# Altium project Stepper_STM32_V8.PrjPcb
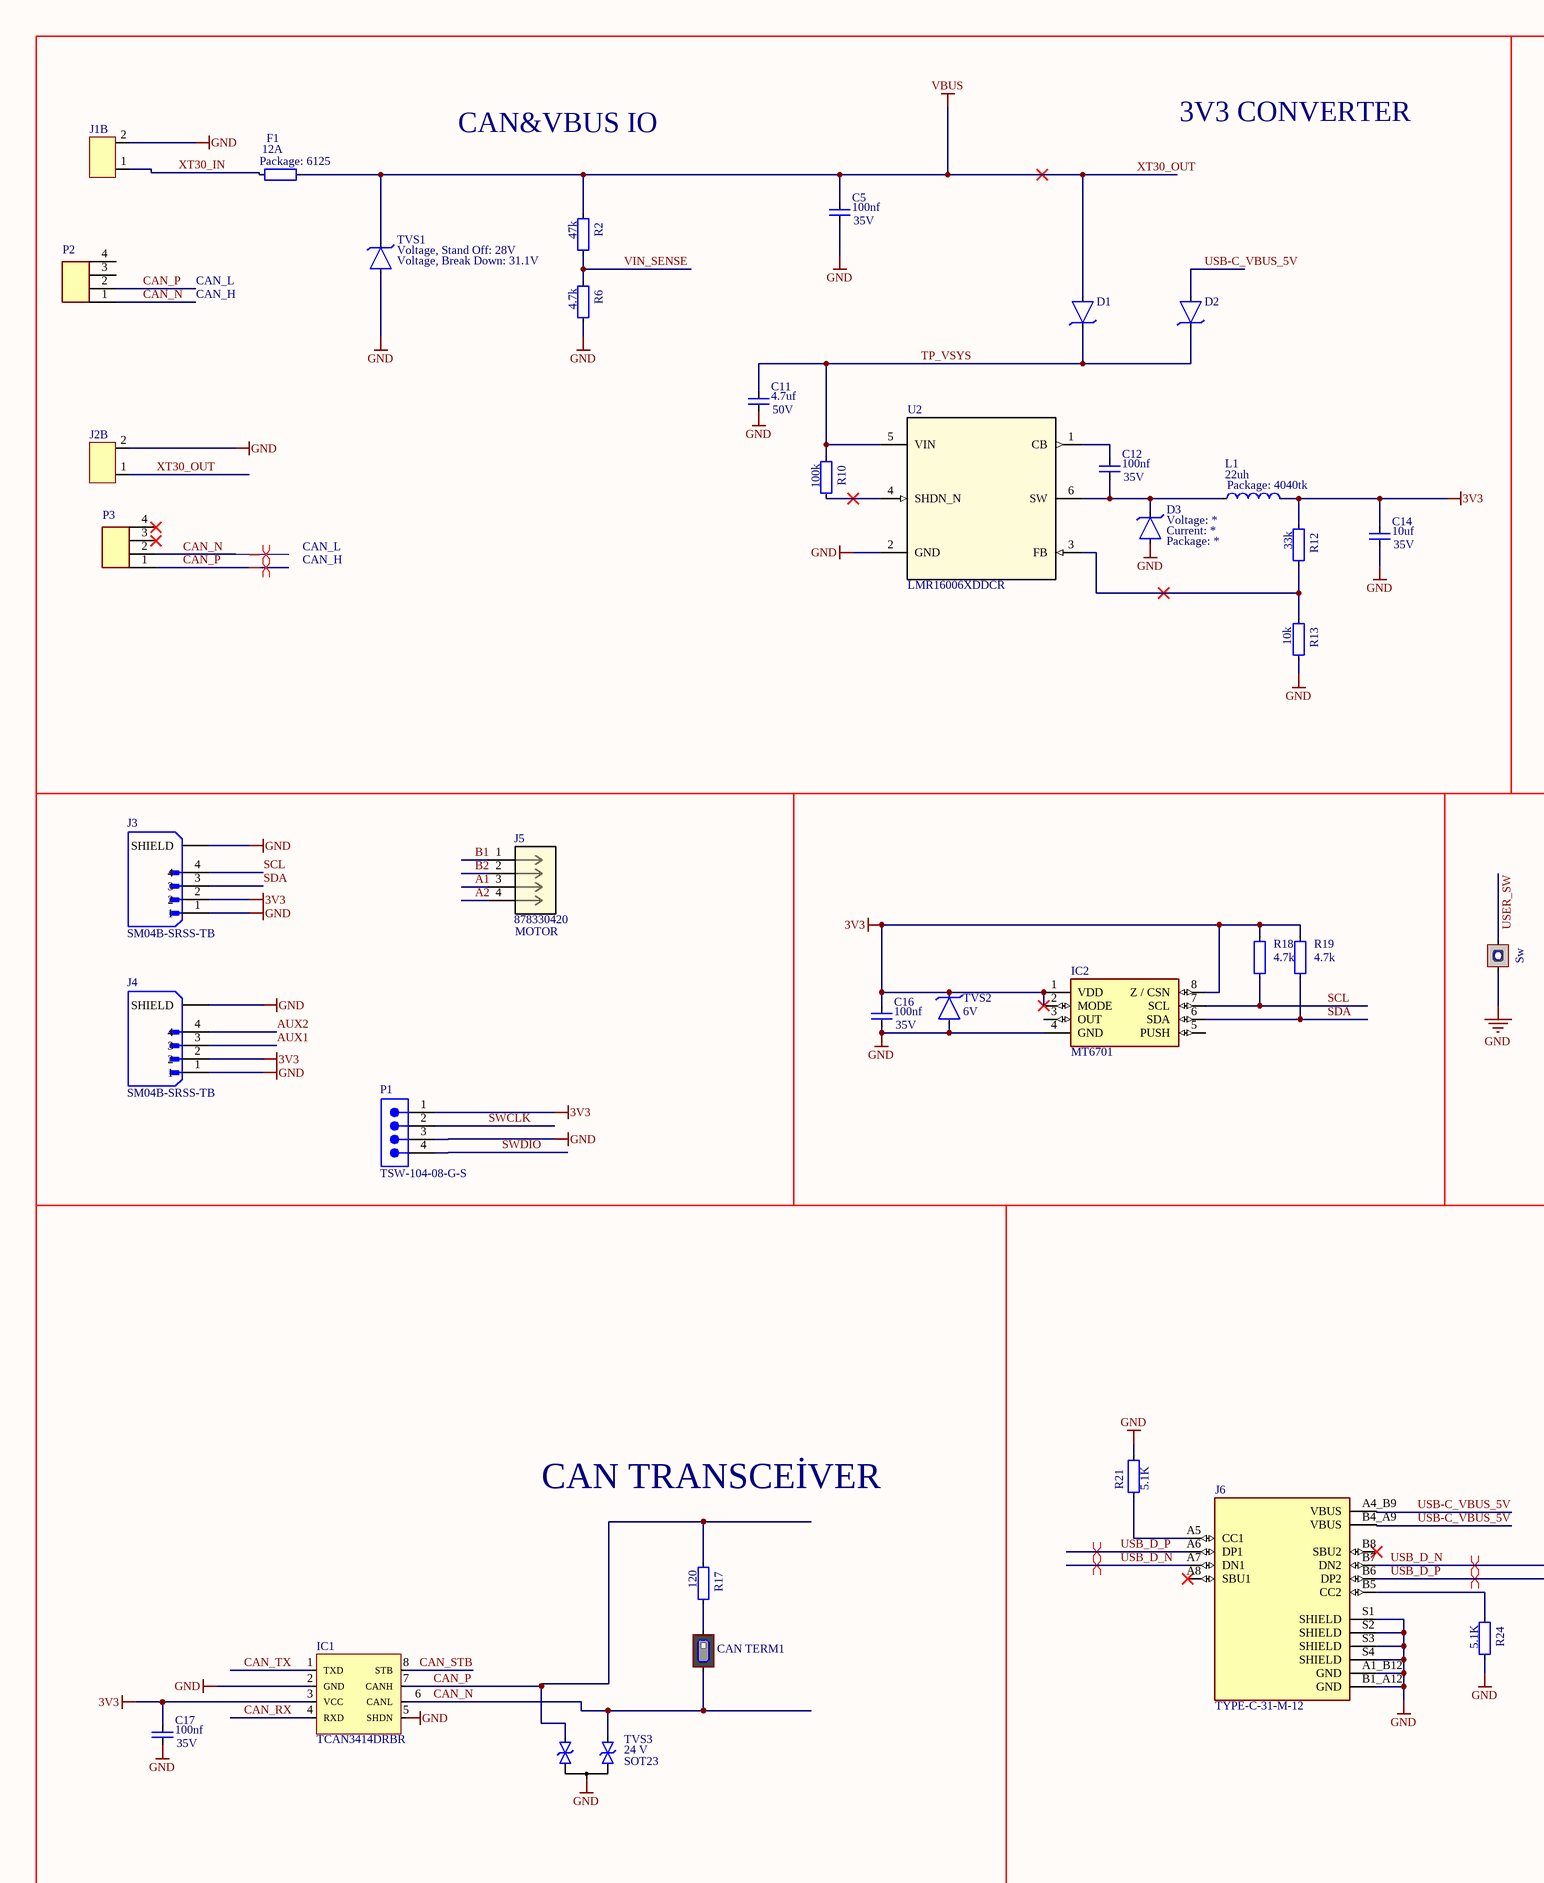
[diagram p0: CanBUS_stepper_STM32.SchDoc, left]
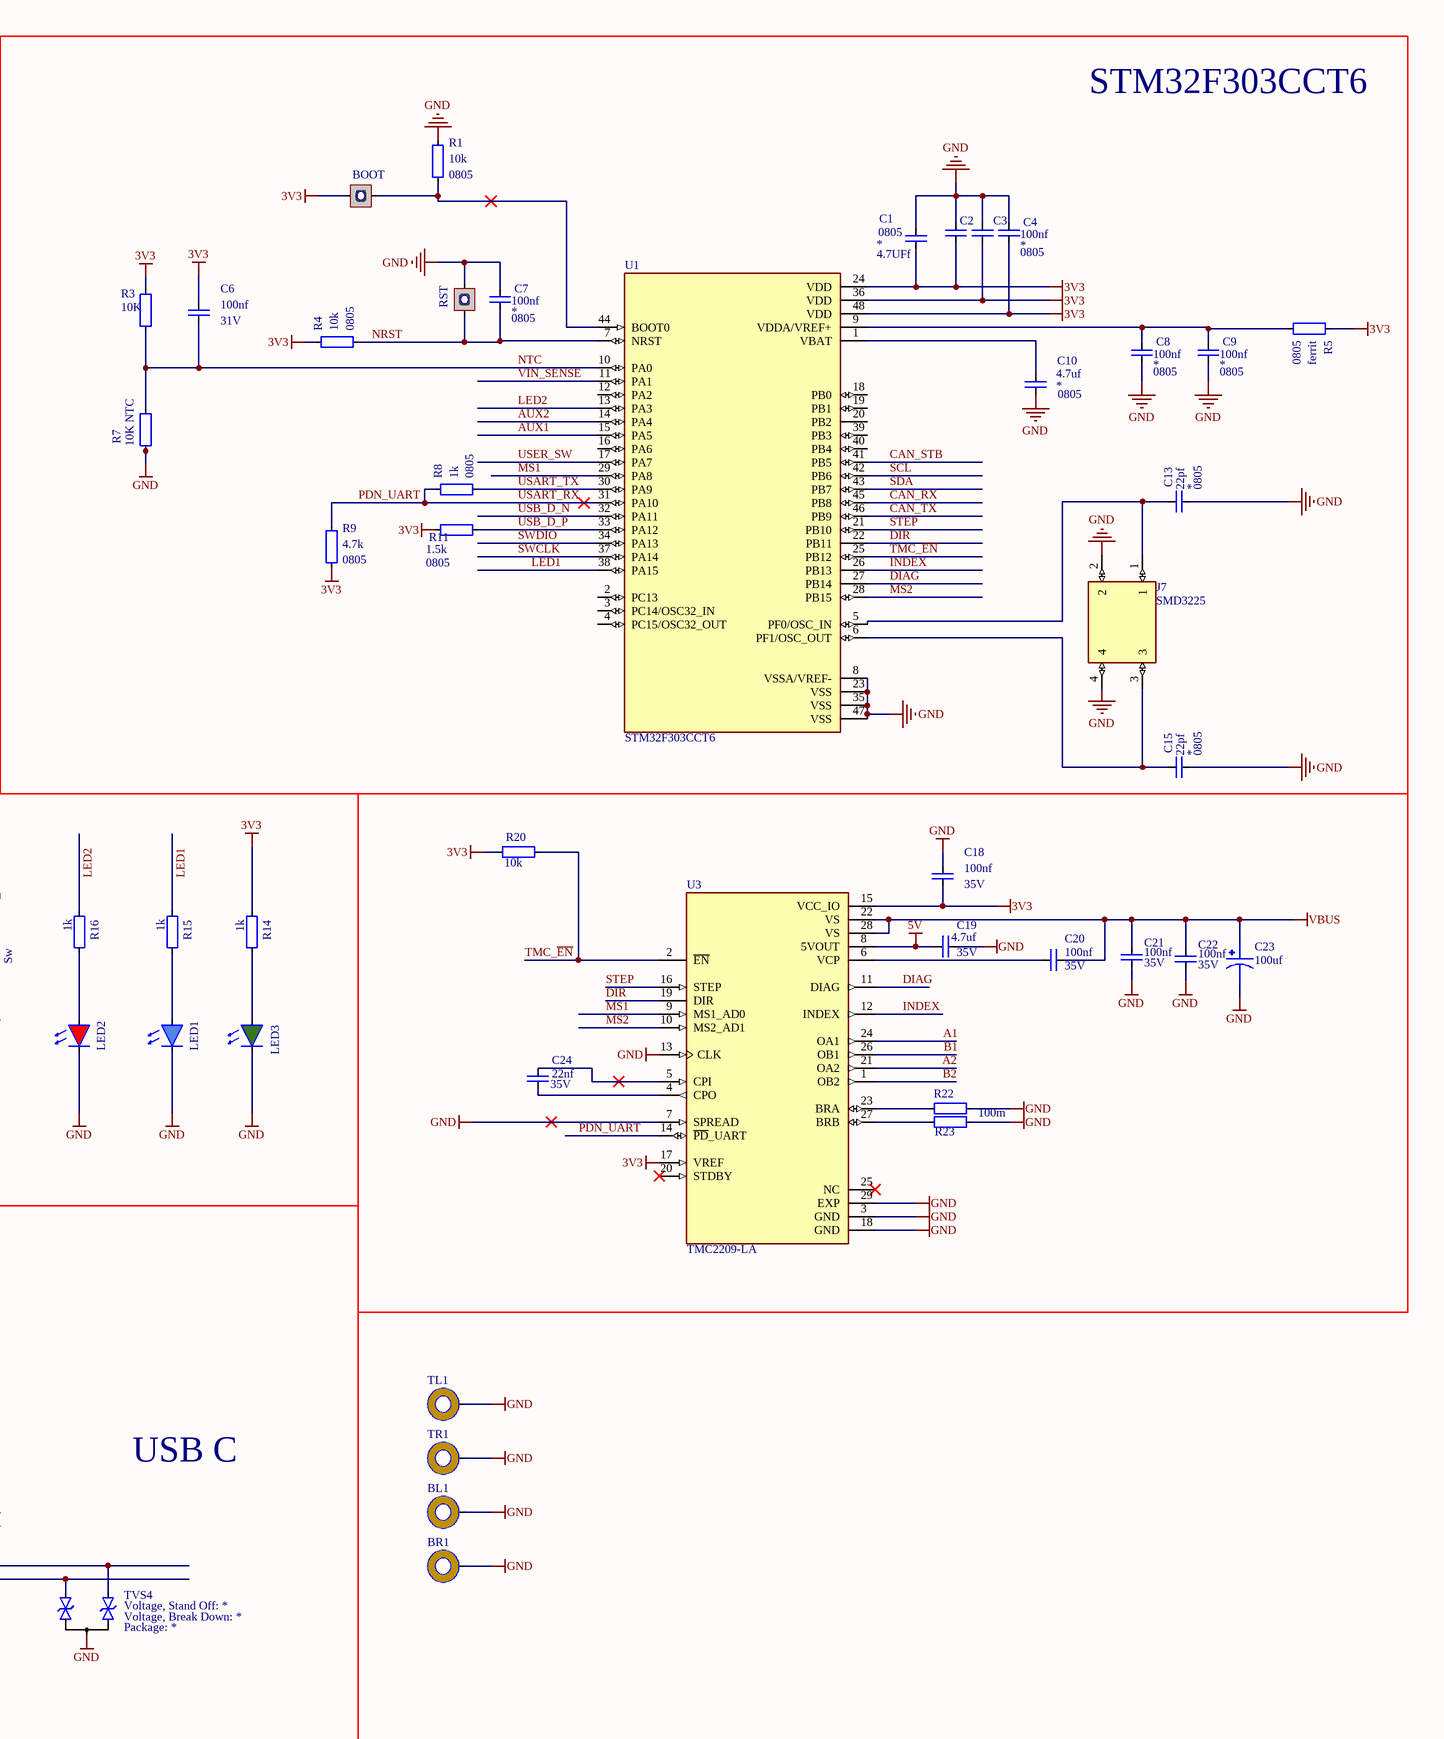
[diagram p1: CanBUS_stepper_STM32.SchDoc, right]
1 sheet, 83 parts. Net scope: global (net labels, ports and power ports of the same name join across sheets).
Board file: CanBUS_stepper_STM32.PcbDoc

## Sheet CanBUS_stepper_STM32.SchDoc
size A2; SheetNumber: 1; SheetTotal: 1

### Parts
BL1  Mounting Hole  [Mounting Hole - Hole-3.2mm, Pad-5mm]  (value not drawn)  (no BOM)
BOOT  Tactile, SPST  [SW_PTS810_SJM_250_SMTR_LFS]  (value not drawn)
BR1  Mounting Hole  [Mounting Hole - Hole-3.2mm, Pad-5mm]  (value not drawn)  (no BOM)
C1  value 4.7UFf  Package: 0805  [Capacitor_Ceramic_M2012_I0805]  (hidden comment: Capacitor_Ceramic)
C2  Capacitor_Ceramic  [Capacitor_Ceramic_M2012_I0805]  (value not drawn)
C3  Capacitor_Ceramic  [Capacitor_Ceramic_M2012_I0805]  (value not drawn)
C4  value 100nf  Package: 0805  [Capacitor_Ceramic_M2012_I0805]  (hidden comment: Capacitor_Ceramic)
C5  value 100nf  Voltage: 35V  [Capacitor_Ceramic_M2012_I0805]  (hidden comment: Capacitor_Ceramic)
C6  value 100nf  Voltage: 31V  [Capacitor_Ceramic_M2012_I0805]  (hidden comment: Capacitor_Ceramic)
C7  value 100nf  Package: 0805  [Capacitor_Ceramic_M2012_I0805]  (hidden comment: Capacitor_Ceramic)
C8  value 100nf  Package: 0805  [Capacitor_Ceramic_M2012_I0805]  (hidden comment: Capacitor_Ceramic)
C9  value 100nf  Package: 0805  [Capacitor_Ceramic_M2012_I0805]  (hidden comment: Capacitor_Ceramic)
C10  value 4.7uf  Package: 0805  [Capacitor_Ceramic_M2012_I0805]  (hidden comment: Capacitor_Ceramic)
C11  value 4.7uf  Voltage: 50V  [Capacitor_Ceramic_M2012_I0805]  (hidden comment: Capacitor_Ceramic)
C12  value 100nf  Voltage: 35V  [Capacitor_Ceramic_M2012_I0805]  (hidden comment: Capacitor_Ceramic)
C13  value 22pf  Package: 0805  [Capacitor_Ceramic_M2012_I0805]  (hidden comment: Capacitor_Ceramic)
C14  value 10uf  Voltage: 35V  [Capacitor_Ceramic_M3216_I1206]  (hidden comment: Capacitor_Ceramic)
C15  value 22pf  Package: 0805  [Capacitor_Ceramic_M2012_I0805]  (hidden comment: Capacitor_Ceramic)
C16  value 100nf  Voltage: 35V  [Capacitor_Ceramic_M2012_I0805]  (hidden comment: Capacitor_Ceramic)
C17  value 100nf  Voltage: 35V  [Capacitor_Ceramic_M2012_I0805]  (hidden comment: Capacitor_Ceramic)
C18  value 100nf  Voltage: 35V  [Capacitor_Ceramic_M2012_I0805]  (hidden comment: Capacitor_Ceramic)
C19  value 4.7uf  Voltage: 35V  [Capacitor_Ceramic_M2012_I0805]  (hidden comment: Capacitor_Ceramic)
C20  value 100nf  Voltage: 35V  [Capacitor_Ceramic_M2012_I0805]  (hidden comment: Capacitor_Ceramic)
C21  value 100nf  Voltage: 35V  [Capacitor_Ceramic_M2012_I0805]  (hidden comment: Capacitor_Ceramic)
C22  value 100nf  Voltage: 35V  [Capacitor_Ceramic_M2012_I0805]  (hidden comment: Capacitor_Ceramic)
C23  value 100uf  [CAPACİTOR_6.3_5.4]  (hidden comment: MAL214699103E3)
C24  value 22nf  Voltage: 35V  [Capacitor_Ceramic_M2012_I0805]  (hidden comment: Capacitor_Ceramic)
CAN_TERM1  Slide, SPST  [Slide, SPST - C&K, SDA01HxS]  (value not drawn)
D1  Diode_Tvs  [DO214AA SMB]  (value not drawn)
D2  Diode_Tvs  [DO214AA SMB]  (value not drawn)
D3  Diode_Zener  [Diode_SOD-123F]  (value not drawn)
F1  value 12A  Package: 6125  [Resistor_Smd_M6332_I2512]  (hidden comment: Resistor)
IC1  TCAN3414DRBR  [TCAN3414DRBR]
IC2  MT6701  [SOIC-8, NB]
J1  2pin_header  [2pin_header]  (value not drawn)  (part B of 2)
J2  2pin_header  [2pin_header]  (value not drawn)  (part B of 2)
J3  SM04B-SRSS-TB  [SM04B-SRSS-TB]
J4  SM04B-SRSS-TB  [SM04B-SRSS-TB]
J5  878330420  [0878330420]
J6  TYPE-C-31-M-12  [HRO_TYPE-C-31-M-12]
J7  SMD3225  [SMD3225]
L1  value 22uh  Package: 4040tk  [Taiyo Yuden - Power Inductor, 4040TK]  (hidden comment: Inductor)
LED1  Diode_Led  [Diode_Smd_M1608_I0603_Blue]  (value not drawn)
LED2  Diode_Led  [Diode_Smd_M1608_I0603_Red]  (value not drawn)
LED3  Diode_Led  [Diode_Smd_M1608_I0603_Green]  (value not drawn)
P1  TSW-104-08-G-S  [SMTC-TSW-104-08-X-S]
P2  S2B-ZR-SM4A-TF  [JST_S2B-ZR-SM4A-TF]  (value not drawn)
P3  S2B-ZR-SM4A-TF  [JST_S2B-ZR-SM4A-TF]  (value not drawn)
R1  value 10k  Package: 0805  [Resistor_Smd_M2012_I0805]  (hidden comment: Resistor)
R2  value 47k  [Resistor_Smd_M2012_I0805]  (hidden comment: Resistor)
R3  value 10K  [Resistor_Smd_M2012_I0805]  (hidden comment: Resistor)
R4  value 10k  Package: 0805  [Resistor_Smd_M2012_I0805]  (hidden comment: Resistor)
R5  value ferrit  Package: 0805  [Resistor_Smd_M2012_I0805]  (hidden comment: Resistor)
R6  value 4.7k  [Resistor_Smd_M2012_I0805]  (hidden comment: Resistor)
R7  value 10K NTC  [Resistor_Smd_M2012_I0805]  (hidden comment: Resistor)
R8  value 1k  Package: 0805  [Resistor_Smd_M2012_I0805]  (hidden comment: Resistor)
R9  value 4.7k  Package: 0805  [Resistor_Smd_M2012_I0805]  (hidden comment: Resistor)
R10  value 100k  [Resistor_Smd_M2012_I0805]  (hidden comment: Resistor)
R11  value 1.5k  Package: 0805  [Resistor_Smd_M2012_I0805]  (hidden comment: Resistor)
R12  value 33k  [Resistor_Smd_M2012_I0805]  (hidden comment: Resistor)
R13  value 10k  [Resistor_Smd_M2012_I0805]  (hidden comment: Resistor)
R14  value 1k  [Resistor_Smd_M2012_I0805]  (hidden comment: Resistor)
R15  value 1k  [Resistor_Smd_M2012_I0805]  (hidden comment: Resistor)
R16  value 1k  [Resistor_Smd_M2012_I0805]  (hidden comment: Resistor)
R17  value 120  [Resistor_Smd_M2012_I0805]  (hidden comment: Resistor)
R18  value 4.7k  [Resistor_Smd_M2012_I0805]  (hidden comment: Resistor)
R19  value 4.7k  [Resistor_Smd_M2012_I0805]  (hidden comment: Resistor)
R20  value 10k  [Resistor_Smd_M2012_I0805]  (hidden comment: Resistor)
R21  value 5.1K  [Resistor_Smd_M2012_I0805]  (hidden comment: Resistor)
R22  value 100m  [Resistor_Smd_M3216_I1206]  (hidden comment: Resistor)
R23  Resistor  [Resistor_Smd_M3216_I1206]  (value not drawn)
R24  value 5.1K  [Resistor_Smd_M2012_I0805]  (hidden comment: Resistor)
RST  Tactile, SPST  [SW_PTS810_SJM_250_SMTR_LFS]  (value not drawn)
Sw  Tactile, SPST  [SW_PTS810_SJM_250_SMTR_LFS]  (value not drawn)
TL1  Mounting Hole  [Mounting Hole - Hole-3.2mm, Pad-5mm]  (value not drawn)  (no BOM)
TR1  Mounting Hole  [Mounting Hole - Hole-3.2mm, Pad-5mm]  (value not drawn)  (no BOM)
TVS1  Voltage, Break Down: 31.1V  Voltage, Stand Off: 28V  [DO214AA SMB]  (hidden comment: Diode_Tvs)
TVS2  Voltage, Stand Off: 6V  [DO214AA SMB]  (hidden comment: Diode_Tvs)
TVS3  Voltage, Stand Off: 24 V  Package: SOT23  [Diode_SOT-23-3_2P_Bidirectional_Type_1]  (hidden comment: Diode_Tvs_2P_Bidirectional)
TVS4  Diode_Tvs_2P_Bidirectional  [Diode_SOT-23-3_2P_Bidirectional_Type_1]  (value not drawn)
U1  STM32F303CCT6  [QFP-48, 7mm x 7mm, 0.5mm]
U2  LMR16006XDDCR  [DDC0006A]
U3  TMC2209-LA  [QFN50P500X500X90-29N]

### Blocks framed on the sheet
STM32F303CCT6: BOOT C1-C4 C6-C10 C13 C15 J7 R1 R3-R5 R7-R9 R11 RST U1

### Nets
3V3: BOOT.A C1.1 C2.2 C3.2 C4.2 C6.1 C14.1 C16.1 C17.1 C18.2 IC1.3(VCC) IC2.1(VDD) IC2.2(MODE) IC2.8(Z_/_CSN) J3.2 J4.2 L1.2 P1.1 R3.1 R4.1 R5.1 R9.2 R11.1 R12.2 R14.2 R18.1 R19.1 R20.2 TVS2.C U1.24(VDD) U1.36(VDD) U1.48(VDD) U3.15(VCC_IO) U3.17(VREF)
5V: C19.2 U3.8(5VOUT)
GND: BL1.Hole BR1.Hole C1.2 C2.1 C3.1 C4.1 C5.2 C7.1 C8.2 C9.2 C10.2 C11.2 C13.2 C14.2 C15.2 C16.2 C17.2 C18.1 C19.1 C21.2 C22.2 C23.2(-) D3.A IC1.2(GND) IC1.5(SHDN) IC2.4(GND) J1.2 J2.2 J3.1 J3.SHIELD J4.1 J4.SHIELD J6.A1_B12(GND) J6.B1_A12(GND) J6.S1(SHIELD) J6.S2(SHIELD) J6.S3(SHIELD) J6.S4(SHIELD) J7.2 J7.4 LED1.C LED2.C LED3.C P1.3 R1.1 R6.1 R7.2 R13.1 R21.1 R22.1 R23.1 R24.1 RST.B Sw.B TL1.Hole TR1.Hole TVS1.A TVS2.A TVS3.Common TVS4.Common U1.8(VSSA/VREF-) U1.23(VSS) U1.35(VSS) U1.47(VSS) U2.2(GND) U3.3(GND) U3.7(SPREAD) U3.13(CLK) U3.18(GND) U3.29(EXP)
XT30_OUT: C5.1 C20.1 C21.1 C22.1 C23.1(+) D1.A F1.2 J2.1 R2.2 TVS1.C U3.22(VS) U3.28(VS)  [also labelled VBUS]
A1: J5.3 U3.24(OA1)
A2: J5.4 U3.21(OA2)
AUX1: J4.3 U1.15(PA5)
AUX2: J4.4 U1.14(PA4)
B1: J5.1 U3.26(OB1)
B2: J5.2 U3.1(OB2)
CAN_N: CAN_TERM1.B IC1.6(CANL) P2.1 P3.2 TVS3.D2
CAN_P: IC1.7(CANH) P2.2 P3.1 R17.2 TVS3.D1
CAN_RX: IC1.4(RXD) U1.45(PB8)
CAN_STB: IC1.8(STB) U1.41(PB5)
CAN_TX: IC1.1(TXD) U1.46(PB9)
DIAG: U1.27(PB14) U3.11(DIAG)
DIR: U1.22(PB11) U3.19(DIR)
INDEX: U1.26(PB13) U3.12(INDEX)
LED1: R15.2 U1.38(PA15)
LED2: R16.2 U1.13(PA3)
MS1: U1.29(PA8) U3.9(MS1_AD0)
MS2: U1.28(PB15) U3.10(MS2_AD1)
NRST: C7.2 R4.2 RST.A U1.7(NRST)
NTC: C6.2 R3.2 R7.1 U1.10(PA0)
PDN_UART: R8.1 R9.1 U1.31(PA10) U3.14(~{PD}_UART)  [also labelled USART_RX]
SCL: IC2.7(SCL) J3.4 R18.2 U1.42(PB6)
SDA: IC2.6(SDA) J3.3 R19.2 U1.43(PB7)
STEP: U1.21(PB10) U3.16(STEP)
SWCLK: P1.2 U1.37(PA14)
SWDIO: P1.4 U1.34(PA13)
TMC_~{EN}: R20.1 U1.25(PB12) U3.2(~{EN})
TP_VSYS: C11.1 D1.C D2.C R10.2 U2.5(VIN)
USART_TX: R8.2 U1.30(PA9)
USB-C_VBUS_5V: D2.A J6.A4_B9(VBUS) J6.B4_A9(VBUS)
USB_D_N: J6.A7(DN1) J6.B7(DN2) TVS4.D2 U1.32(PA11)
USB_D_P: J6.A6(DP1) J6.B6(DP2) R11.2 TVS4.D1 U1.33(PA12)
USER_SW: Sw.A U1.17(PA7)
VIN_SENSE: R2.1 R6.2 U1.11(PA1)
XT30_IN: F1.1 J1.1
NetBOOT_B: BOOT.B R1.2 U1.44(BOOT0)
NetC8_1: C8.1 C9.1 R5.2 U1.9(VDDA/VREF+)
NetC10_1: C10.1 U1.1(VBAT)
NetC12_1: C12.1 U2.1(CB)
NetC12_2: C12.2 D3.C L1.1 U2.6(SW)
NetC13_1: C13.1 J7.1 U1.5(PF0/OSC_IN)
NetC15_1: C15.1 J7.3 U1.6(PF1/OSC_OUT)
NetC20_2: C20.2 U3.6(VCP)
NetC24_1: C24.1 U3.5(CPI)
NetC24_2: C24.2 U3.4(CPO)
NetCAN_TERM1_A: CAN_TERM1.A R17.1
NetJ6_A5: J6.A5(CC1) R21.2
NetJ6_B5: J6.B5(CC2) R24.2
NetLED1_A: LED1.A R15.1
NetLED2_A: LED2.A R16.1
NetLED3_A: LED3.A R14.1
NetR10_1: R10.1 U2.4(SHDN_N)
NetR12_1: R12.1 R13.2 U2.3(FB)
NetR22_2: R22.2 U3.23(BRA)
NetR23_2: R23.2 U3.27(BRB)

Not connected (* = marked no-connect by the designer): IC2 3(OUT) 5(PUSH); J6 A8(SBU1)* B8(SBU2)*; P2 3 4; P3 3* 4*; U1 2(PC13) 3(PC14/OSC32_IN) 4(PC15/OSC32_OUT) 12(PA2) 16(PA6) 18(PB0) 19(PB1) 20(PB2) 39(PB3) 40(PB4); U3 20(STDBY)* 25(NC)*

### Layout directives
differential pair: CAN_N, CAN_P, USB_D_N, USB_D_P

### Notes on the sheet
- CAN&VBUS IO
- 3V3 CONVERTER
- CAN_L
- CAN_H
- (near J5) MOTOR
- CAN TRANSCEİVER
- USB C

### Library data of the parts
BL1 BR1 TL1 TR1 = Mounting Hole: Mechanical, Mounting Hole; Component Type: Mounting Hole; Component Category: Mechanical
BOOT RST Sw = Tactile, SPST: *; Component Category: Switch; ComponentLink1Description: Datasheet; ComponentLink1URL: *; ComponentLink2Description: Supplier Link; ComponentLink2URL: *; Supplier: *; Supplier Part Number: *; Operating Temperature, Min: -*℃; Operating Temperature, Max: +*℃; Quantity, Min: *; Quantity, Max: *; Price, Min: *; Supplier Currency: *; Price, Max: *; Supplier Link: *; Component Type: Tactile; Manufacturer: *; Package: *; Manufacturer Part Number: *
C23 = MAL214699103E3: 100 ÂµF 50 V Aluminum Electrolytic Capacitors Radial, Can - SMD - 1500 Hrs @ 125Â°C; MF: Vishay BC; Package: Radial Vishay BC; Price: None; Check_prices: https://www.snapeda.com/parts/MAL214699103E3/Vishay+BC+Components/view-part/?ref=eda; SnapEDA_Link: https://www.snapeda.com/parts/MAL214699103E3/Vishay+BC+Components/view-part/?ref=snap; MP: MAL214699103E3; Availability: In Stock; Purchase-URL: https://pricing.snapeda.com/search?q=MAL214699103E3&ref=eda
CAN_TERM1 = Slide, SPST: *; Component Category: Switch; ComponentLink1Description: Datasheet; ComponentLink1URL: *; ComponentLink2Description: Supplier Link; ComponentLink2URL: *; Supplier: *; Supplier Part Number: *; Operating Temperature, Min: -*℃; Operating Temperature, Max: +*℃; Quantity, Min: *; Quantity, Max: *; Price, Min: *; Supplier Currency: *; Price, Max: *; Supplier Link: *; Component Type: Slide; Manufacturer: *; Package: *; Manufacturer Part Number: *
D1 D2 TVS1 TVS2 = Diode_Tvs: Component Category: Diode; ComponentLink1Description: Datasheet; ComponentLink1URL: *; ComponentLink2Description: Supplier Link; Manufacturer Part Number: *; Supplier: *; Supplier Part Number: *; Manufacturer: *; Operating Temperature, Min: *℃; Operating Temperature, Max: *℃; Quantity, Min: *; Quantity, Max: *; Price, Min: *; Price, Max: *; Supplier Currency: *; Supplier Link: *; Component Type: Zener; Package: *
  D1 D2: ComponentLink2URL: https://www.e-komponent.com/diode-30-v
  TVS1: ComponentLink2URL: https://www.ozdisan.com/p/tvs-diyotlar-386/hottech-smbj28a-ht-503588
  TVS2: ComponentLink2URL: *; Voltage, Break Down: *
D3 = Diode_Zener: Component Category: Diode; ComponentLink1Description: Datasheet; ComponentLink1URL: *; ComponentLink2Description: Supplier Link; ComponentLink2URL: *; Manufacturer Part Number: *; Supplier: *; Supplier Part Number: *; Manufacturer: *; Operating Temperature, Min: *℃; Operating Temperature, Max: *℃; Quantity, Min: *; Quantity, Max: *; Price, Min: *; Price, Max: *; Supplier Currency: *; Supplier Link: *; Component Type: Zener; Current: *; Voltage: *; Package: *
F1 = Resistor: Component Category: fuse; Component Type: Fixed Value; Tolerance: *; Supplier Link: https://www.e-komponent.com/12-a-125-v-ac-125-v-dc-fuse-board-mount; Supplier Currency: *; Price, Max: *; Price, Min: *; Quantity, Max: *; Quantity, Min: *; Operating Temperature, Max: *℃; Operating Temperature, Min: *℃; Manufacturer: *; Supplier Part Number: *; Supplier: *; Manufacturer Part Number: *; ComponentLink1Description: Datasheet; ComponentLink1URL: *; ComponentLink2Description: Supplier Link; ComponentLink2URL: https://www.e-komponent.com/12-a-125-v-ac-125-v-dc-fuse-board-mount
IC2 = MT6701: Hall Effect Sensor Angle External Magnet, Not Included Gull Wing; MF: ams; MP: AS5600-ASOT; SnapEDA_Link: https://www.snapeda.com/parts/AS5600-ASOT/ams/view-part/?ref=snap; Package: SOIC-8 ams; Value: *; Check_prices: https://www.snapeda.com/parts/AS5600-ASOT/ams/view-part/?ref=eda
J3 J4 = SM04B-SRSS-TB: Connector Header Surface Mount 4 position 0.079 (2.00mm); MF: JST Sales; MP: B4B-PH-SM4-TB (LF)(SN); SnapEDA_Link: https://www.snapeda.com/parts/B4B-PH-SM4-TB%20(LF)(SN)/JST+Sales+America+Inc./view-part/?ref=snap; Package: NON STANDARD-4 JST; Value: *; Check_prices: https://www.snapeda.com/parts/B4B-PH-SM4-TB%20(LF)(SN)/JST+Sales+America+Inc./view-part/?ref=eda
J5 = 878330420: 2.00mm Pitch, Milli-Grid PCB Header, Dual Row, Right-Angle, Through Hole, 4 Circuits, 0.38Âµm Gold (Au) Plating, without PCB Locator, without  Locking Window, without Center Polarization Slot, Tube; Manufacturer_Name: Molex Connector Corporation; RefDes: RefDes; Type: Type; Manufacturer_Part_Number: 878330420; Copyright: Copyright (C) 2026 Ultra Librarian. All rights reserved.
J6 = TYPE-C-31-M-12: USB Connectors 24 Receptacle 1 8.94*7.3mm RoHS; MF: HRO Electronics Co., Ltd.; SnapEDA_Link: https://www.snapeda.com/parts/TYPE-C-31-M-12/HRO+Electronics+Co.%252C+Ltd./view-part/?ref=snap; Package: Package; Value: *; MP: TYPE-C-31-M-12; Check_prices: https://www.snapeda.com/parts/TYPE-C-31-M-12/HRO+Electronics+Co.%252C+Ltd./view-part/?ref=eda
J7 = SMD3225: MF: Others; SnapEDA_Link: https://www.snapeda.com/parts/SMD3225/Byte+Brothers/view-part/?ref=snap; Package: None; Value: *; MP: SMD3225; Check_prices: https://www.snapeda.com/parts/SMD3225/Byte+Brothers/view-part/?ref=eda
L1 = Inductor: Inductor, Power, ???uH, ???A, ?x?x?mm; ComponentLink1Description: Datasheet; ComponentLink1URL: *; ComponentLink2Description: Supplier Link; ComponentLink2URL: *; Manufacturer Part Number: *; Supplier: *; Supplier Part Number: *; Manufacturer: *; Operating Temperature, Min: *℃; Operating Temperature, Max: *℃; Quantity, Min: *; Quantity, Max: *; Price, Min: *; Price, Max: *; Supplier Currency: *; Supplier Link: *; Component Type: Power Inductor; Component Category: Inductor; Saturation Current: *
LED1-LED3 = Diode_Led: Component Category: Diode; ComponentLink1Description: Datasheet; ComponentLink1URL: *; ComponentLink2Description: Supplier Link; ComponentLink2URL: *; Manufacturer Part Number: *; Supplier: *; Supplier Part Number: *; Manufacturer: *; Operating Temperature, Min: *℃; Operating Temperature, Max: *℃; Quantity, Min: *; Quantity, Max: *; Price, Min: *; Price, Max: *; Supplier Currency: *; Supplier Link: *; Component Type: Led
P1 = CMP-1024-00357-1: 0.025" SQ Post Header, Through-hole, Vertical, -55 to 125 degC, 2.54 mm Pitch, 4-Pin, Male, RoHS; Manufacturer: Samtec; Pitch: 2.54 mm; RoHS: True; ComponentLink3URL: http://www.samtec.com/documents/webfiles/cpdf/TSW-XXX-XX-XXX-X-XX-XXX-MKT.pdf; Mounting Technology: Through-hole; ComponentLink2URL: http://www.samtec.com/documents/webfiles/pdf/TSW_TH.PDF; ComponentLink1URL: http://www.samtec.com; ComponentLink3Description: Package Specification; PackageVersion: DM, 8/1988; ComponentLink2Description: Datasheet; PackageReference: TSW-104-08-X-S; PackageDescription: .025[0.64] SQ. Post Terminal Strip Assembly; PartNumber: TSW-104-08-G-S; ComponentLink1Description: Manufacturer URL; Temperature Range: -55 to 125 degC; DatasheetVersion: F-214; Orientation: Vertical
P2 P3 = S2B-ZR-SM4A-TF: Connector Header Surface Mount, Right Angle 2 position 0.059 (1.50mm); MF: JST Sales; SnapEDA_Link: https://www.snapeda.com/parts/S2B-ZR-SM4A-TF/JST/view-part/?ref=snap; Package: None; Value: *; MP: S2B-ZR-SM4A-TF; Check_prices: https://www.snapeda.com/parts/S2B-ZR-SM4A-TF/JST/view-part/?ref=eda
TVS3 = Diode_Tvs_2P_Bidirectional: Component Category: Diode; Voltage, Break Down: 26.2 V; ComponentLink1Description: Datasheet; ComponentLink1URL: *; ComponentLink2Description: Supplier Link; ComponentLink2URL: *; Manufacturer Part Number: *; Supplier: *; Supplier Part Number: *; Manufacturer: *; Operating Temperature, Min: *℃; Operating Temperature, Max: *℃; Quantity, Min: *; Quantity, Max: *; Price, Min: *; Price, Max: *; Supplier Currency: *; Supplier Link: *; Component Type: TVS
TVS4 = Diode_Tvs_2P_Bidirectional: Component Category: Diode; ComponentLink1Description: Datasheet; ComponentLink1URL: *; ComponentLink2Description: Supplier Link; ComponentLink2URL: *; Manufacturer Part Number: *; Supplier: *; Supplier Part Number: *; Manufacturer: *; Operating Temperature, Min: *℃; Operating Temperature, Max: *℃; Quantity, Min: *; Quantity, Max: *; Price, Min: *; Price, Max: *; Supplier Currency: *; Supplier Link: *; Component Type: TVS; Voltage, Break Down: *; Voltage, Stand Off: *; Package: *
U1 = STM32F303CCT6: ARMÂ® CortexÂ®-M4 STM32F3 Microcontroller IC 32-Bit 72MHz 256KB (256K x 8) FLASH 48-LQFP (7x7); MF: STMicroelectronics; Purchase-URL: https://pricing.snapeda.com/search/part/STM32F303CCT6/?ref=eda; MP: STM32F303CCT6; Package: LQFP-48 STMicroelectronics; Availability: In Stock; Value: *; Price: None; Check_prices: https://www.snapeda.com/parts/STM32F303CCT6/STMicroelectronics/view-part/?ref=eda; SnapEDA_Link: https://www.snapeda.com/parts/STM32F303CCT6/STMicroelectronics/view-part/?ref=snap
U2 = LMR16006XDDCR: SIMPLE SWITCHER&reg; 4V to 60V, 600mA Step-Down Regulator with Low Iq 6-SOT-23-THIN -40 to 125; Manufacturer_Name: Texas Instruments; CompType: IC; TYPE: TYPE; RefDes: RefDes; Copyright: Copyright (C) 2026 Ultra Librarian. All rights reserved.; Manufacturer_Part_Number: LMR16006XDDCR; PartNumber: LMR16006XDDC; PackageReference: DDC0006A; MountType: SMT; RoHS: Y; Manufacturer: Texas Instruments
U3 = TMC2209-LA: Bipolar Motor Driver Power MOSFET Step/Direction, UART 28-QFN (5x5); MF: Maxim Integrated Products; SnapEDA_Link: https://www.snapeda.com/parts/TMC2209-LA/Maxim+Integrated/view-part/?ref=snap; Package: None; Value: *; MP: TMC2209-LA; Check_prices: https://www.snapeda.com/parts/TMC2209-LA/Maxim+Integrated/view-part/?ref=eda
C1-C22 C24 = Capacitor_Ceramic: ComponentLink1Description: Datasheet; ComponentLink1URL: *; ComponentLink2Description: Supplier Link; ComponentLink2URL: *; Temperature Coefficient: *; Manufacturer Part Number: *; Supplier: *; Supplier Part Number: *; Manufacturer: *; Operating Temperature, Min: *℃; Operating Temperature, Max: *℃; Quantity, Min: *; Quantity, Max: *; Price, Min: *; Supplier Currency: *; Price, Max: *; Supplier Link: *; Tolerance: *; Component Type: Ceramic; Component Category: Capacitor
  C1 C4 C7-C10 C13 C15: Voltage: *
  C5 C6 C11 C12 C14 C16-C22 C24: Package: 0.805
R1-R24 = Resistor: Component Category: Resistor; Component Type: Fixed Value; Tolerance: *; Supplier Link: *; Supplier Currency: *; Price, Max: *; Price, Min: *; Quantity, Max: *; Quantity, Min: *; Operating Temperature, Max: *℃; Operating Temperature, Min: *℃; Manufacturer: *; Supplier Part Number: *; Supplier: *; Manufacturer Part Number: *; ComponentLink1Description: Datasheet; ComponentLink1URL: *; ComponentLink2Description: Supplier Link; ComponentLink2URL: *
  R2 R3 R6 R7 R10 R12-R24: Package: 0.805